# Altium schematic sheet NOR_flash.SchDoc
size A3; SheetNumber: 9; SheetTotal: 16
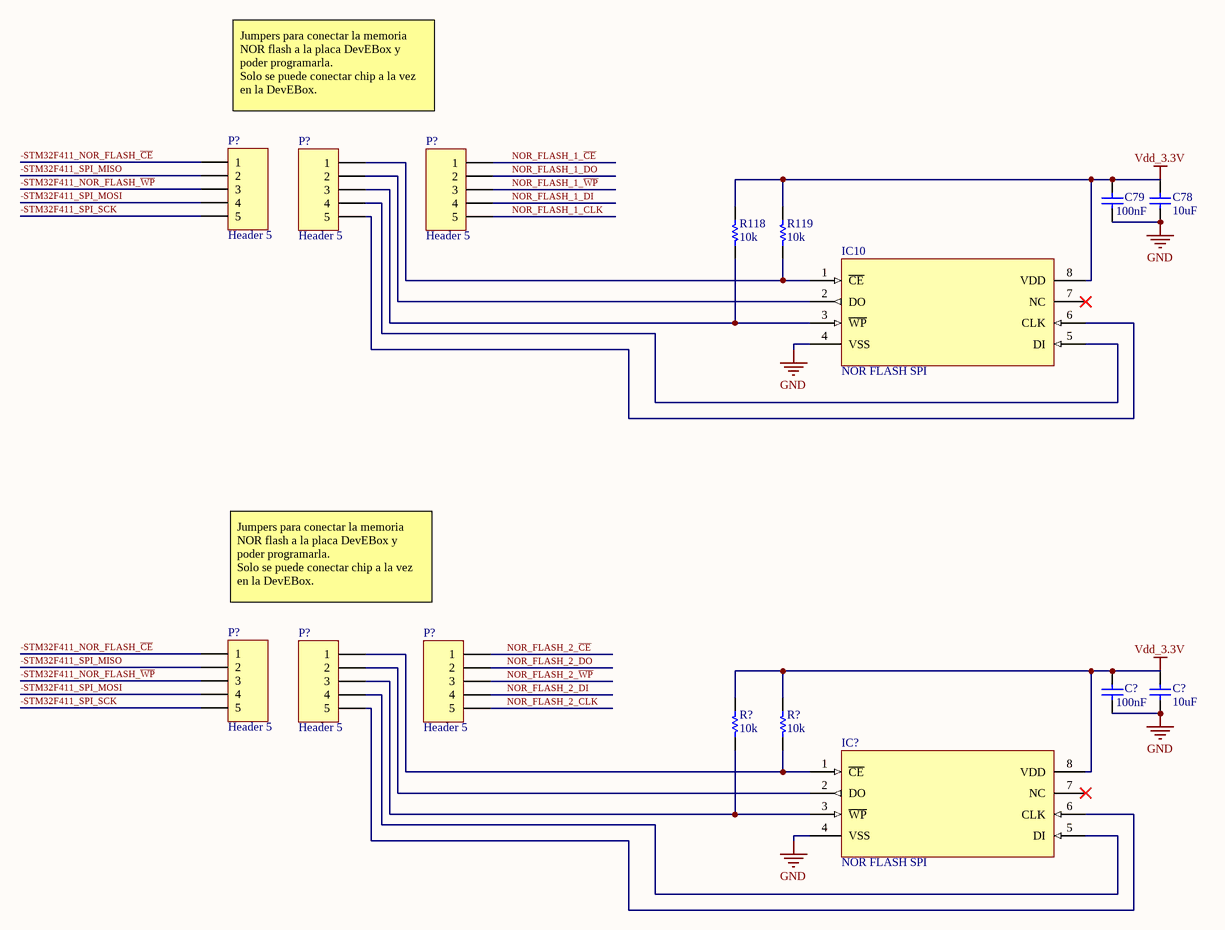
[diagram p0: NOR_flash.SchDoc]

## Parts
(Parts that share a designator on the sheet are numbered #1, #2 ... from top to bottom, then left to right.)
C78  value 10uF  [capacitor 0603]  (hidden comment: ceramic capacitor)
C79  value 100nF  [capacitor 0603]  (hidden comment: Ceramic capacitor)
C?#1  value 100nF  [capacitor 0603]  (hidden comment: Ceramic capacitor)
C?#2  value 10uF  [capacitor 0603]  (hidden comment: ceramic capacitor)
IC10  NOR FLASH SPI  [SOP8 / SOIC8 without dissipation]
IC?  NOR FLASH SPI  [SOP8 / SOIC8 without dissipation]
P?#1  Header 5  [HDR1X5]
P?#2  Header 5  [HDR1X5]
P?#3  Header 5  [HDR1X5]
P?#4  Header 5  [HDR1X5]
P?#5  Header 5  [HDR1X5]
P?#6  Header 5  [HDR1X5]
R118  value 10k  [resistor 0603]  (hidden comment: resistor)
R119  value 10k  [resistor 0603]  (hidden comment: resistor)
R?#1  value 10k  [resistor 0603]  (hidden comment: resistor)
R?#2  value 10k  [resistor 0603]  (hidden comment: resistor)

## Nets
GND: C78.1 C79.1 C?#1.1 C?#2.1 IC10.4(VSS) IC?.4(VSS)
Vdd_3.3V: C78.2 C79.2 C?#1.2 C?#2.2 IC10.8(VDD) IC?.8(VDD) R118.1 R119.1 R?#1.1 R?#2.1
-STM32F411_NOR_FLASH_~{CE}: P?#1.1 P?#4.1
-STM32F411_NOR_FLASH_~{WP}: P?#1.3 P?#4.3
-STM32F411_SPI_MISO: P?#1.2 P?#4.2
-STM32F411_SPI_MOSI: P?#1.4 P?#4.4
-STM32F411_SPI_SCK: P?#1.5 P?#4.5
NOR_FLASH_1_~{CE}: P?#3.1
NOR_FLASH_1_CLK: P?#3.5
NOR_FLASH_1_DI: P?#3.4
NOR_FLASH_1_DO: P?#3.2
NOR_FLASH_1_~{WP}: P?#3.3
NOR_FLASH_2_~{CE}: P?#6.1
NOR_FLASH_2_CLK: P?#6.5
NOR_FLASH_2_DI: P?#6.4
NOR_FLASH_2_DO: P?#6.2
NOR_FLASH_2_~{WP}: P?#6.3
NetIC10_1: IC10.1(~{CE}) P?#2.1 R119.2
NetIC10_2: IC10.2(DO) P?#2.2
NetIC10_3: IC10.3(~{WP}) P?#2.3 R118.2
NetIC10_5: IC10.5(DI) P?#2.4
NetIC10_6: IC10.6(CLK) P?#2.5
NetIC?_1: IC?.1(~{CE}) P?#5.1 R?#2.2
NetIC?_2: IC?.2(DO) P?#5.2
NetIC?_3: IC?.3(~{WP}) P?#5.3 R?#1.2
NetIC?_5: IC?.5(DI) P?#5.4
NetIC?_6: IC?.6(CLK) P?#5.5

Not connected (* = marked no-connect by the designer): IC10 7(NC)*; IC? 7(NC)*

## Notes on the sheet
- (near P?#1) Jumpers para conectar la memoria NOR flash a la placa DevEBox y poder programarla.
  Solo se puede conectar chip a la vez en la DevEBox.
- (near P?#4) Jumpers para conectar la memoria NOR flash a la placa DevEBox y poder programarla.
  Solo se puede conectar chip a la vez en la DevEBox.

## Library data of the parts
C78 C?#2 = ceramic capacitor: Multilayer ceramic capacitor; V: 6.3; LCSC part: C1691; Package: 0603
C79 C?#1 = Ceramic capacitor: Multilayer ceramic capacitor; V: 50; LCSC part: C14663; Package: 0603
IC10 IC? = NOR FLASH SPI: NOR flash memory / SPI
P?#1-P?#6 = Header 5: Header, 5-Pin; LatestRevisionDate: 17-Jul-2002; LatestRevisionNote: Re-released for DXP Platform.; Publisher: Altium Limited
R118 R119 R?#1 R?#2 = resistor: Package: 0603